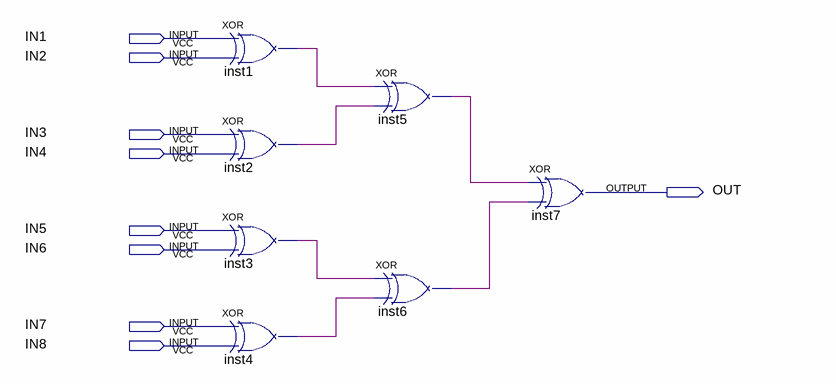
[diagram p0: schematic sheet]
// Quartus schematic XOR8.bdf as structural Verilog: 7 symbols, 9 pins
module XOR8 (
  input  IN1,
  input  IN2,
  input  IN3,
  input  IN4,
  input  IN5,
  input  IN6,
  input  IN7,
  input  IN8,
  output OUT
);

  wire inst1_out, inst2_out, inst3_out, inst4_out, inst5_out, inst6_out;

  xor inst1 (inst1_out, IN1, IN2);
  xor inst2 (inst2_out, IN3, IN4);
  xor inst3 (inst3_out, IN5, IN6);
  xor inst4 (inst4_out, IN7, IN8);
  xor inst5 (inst5_out, inst1_out, inst2_out);
  xor inst6 (inst6_out, inst3_out, inst4_out);
  xor inst7 (OUT, inst5_out, inst6_out);
endmodule
